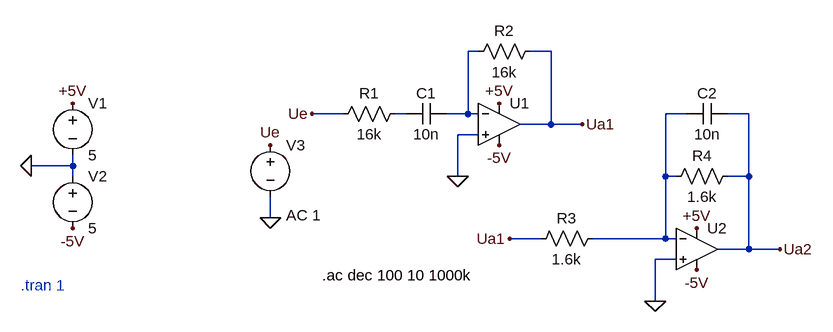
[diagram p0: schematic Draft1.asc]
Draft1.asc, the LTspice schematic file:
Version 4.1
SHEET 1 880 680
WIRE 256 16 240 16
WIRE 368 16 336 16
WIRE 48 112 0 112
WIRE 144 112 128 112
WIRE 240 112 240 16
WIRE 240 112 208 112
WIRE 256 112 240 112
WIRE 576 112 544 112
WIRE 672 112 640 112
WIRE 368 128 368 16
WIRE 368 128 320 128
WIRE 416 128 368 128
WIRE 256 144 224 144
WIRE -368 192 -368 176
WIRE -368 192 -432 192
WIRE -368 208 -368 192
WIRE 224 208 224 144
WIRE 544 208 544 112
WIRE 560 208 544 208
WIRE 672 208 672 112
WIRE 672 208 640 208
WIRE -64 272 -64 240
WIRE 352 304 304 304
WIRE 544 304 544 208
WIRE 544 304 432 304
WIRE 560 304 544 304
WIRE 672 320 672 208
WIRE 672 320 624 320
WIRE 720 320 672 320
WIRE 560 336 528 336
WIRE 528 400 528 336
FLAG 416 128 Ua1
FLAG -432 192 0
FLAG -368 96 +5V
FLAG -368 288 -5V
FLAG 288 96 +5V
FLAG 288 160 -5V
FLAG 224 208 0
FLAG 0 112 Ue
FLAG -64 160 Ue
FLAG -64 272 0
FLAG 592 288 +5V
FLAG 592 352 -5V
FLAG 528 400 0
FLAG 720 320 Ua2
FLAG 304 304 Ua1
SYMBOL voltage -368 80 R0
WINDOW 123 0 0 Left 0
WINDOW 39 0 0 Left 0
SYMATTR InstName V1
SYMATTR Value 5
SYMBOL cap 208 96 R90
WINDOW 0 0 32 VBottom 2
WINDOW 3 32 32 VTop 2
SYMATTR InstName C1
SYMATTR Value 10n
SYMBOL res 144 96 R90
WINDOW 0 0 56 VBottom 2
WINDOW 3 32 56 VTop 2
SYMATTR InstName R1
SYMATTR Value 16k
SYMBOL res 352 0 R90
WINDOW 0 0 56 VBottom 2
WINDOW 3 32 56 VTop 2
SYMATTR InstName R2
SYMATTR Value 16k
SYMBOL OpAmps\\UniversalOpAmp2 288 128 R0
SYMATTR InstName U1
SYMBOL voltage -368 192 R0
WINDOW 123 0 0 Left 0
WINDOW 39 0 0 Left 0
SYMATTR InstName V2
SYMATTR Value 5
SYMBOL voltage -64 144 R0
WINDOW 123 24 124 Left 2
WINDOW 39 0 0 Left 0
SYMATTR Value2 AC 1
SYMATTR InstName V3
SYMATTR Value ""
SYMBOL cap 640 96 R90
WINDOW 0 0 32 VBottom 2
WINDOW 3 32 32 VTop 2
SYMATTR InstName C2
SYMATTR Value 10n
SYMBOL res 448 288 R90
WINDOW 0 0 56 VBottom 2
WINDOW 3 32 56 VTop 2
SYMATTR InstName R3
SYMATTR Value 1.6k
SYMBOL res 656 192 R90
WINDOW 0 0 56 VBottom 2
WINDOW 3 32 56 VTop 2
SYMATTR InstName R4
SYMATTR Value 1.6k
SYMBOL OpAmps\\UniversalOpAmp2 592 320 R0
SYMATTR InstName U2
TEXT -448 376 Left 2 ;.tran 1
TEXT 16 360 Left 2 !.ac dec 100 10 1000k

The netlist it stands for:
* Draft1.asc
V1 +5V 0 5
C1 N001 N002 10n
R1 N002 Ue 16k
R2 Ua1 N001 16k
X§U1 0 N001 +5V -5V Ua1 level2 Avol=1Meg GBW=10Meg Slew=10Meg Ilimit=25m Rail=0 Vos=0 En=0 Enk=0 In=0 Ink=0 Rin=500Meg  ; pins In+ In- V+ V- OUT
V2 0 -5V 5
V3 Ue 0 AC 1
C2 Ua2 N003 10n
R3 N003 Ua1 1.6k
R4 Ua2 N003 1.6k
X§U2 0 N003 +5V -5V Ua2 level2 Avol=1Meg GBW=10Meg Slew=10Meg Ilimit=25m Rail=0 Vos=0 En=0 Enk=0 In=0 Ink=0 Rin=500Meg  ; pins In+ In- V+ V- OUT
* .tran 1
.ac dec 100 10 1000k
.lib UniversalOpAmp2.lib
.backanno
.end

* Results of the author's LTspice run, read from the files saved beside the schematic
* Operating Point, zero values left out:
*   V(+5v) = 5 V
*   V(-5v) = -5 V
*   I(V1) = -999.9 µA
*   I(V2) = -999.9 µA
*   Ix(u2:3) = 500 µA
*   Ix(u2:4) = -500 µA
*   Ix(u1:3) = 500 µA
*   Ix(u1:4) = -500 µA
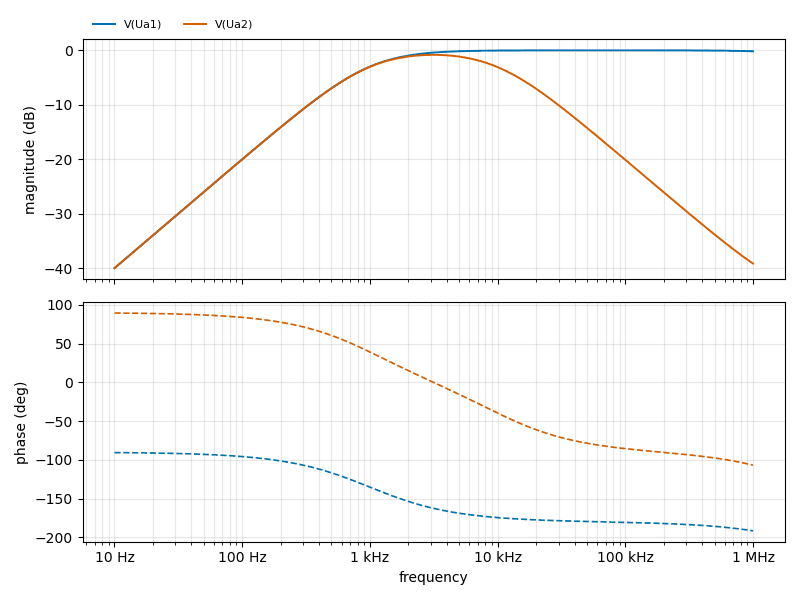
[diagram p1: AC Analysis of Draft1.asc, plotted from the saved traces]
* AC Analysis, 1 run:
*   V(Ua1): -39.95 dB at 10 Hz, -0.18 dB at 1 MHz, peak -0.00 dB at 69.18 kHz, 3 dB below the peak at 994.5 Hz
*   V(Ua2): -39.95 dB at 10 Hz, -39.11 dB at 1 MHz, peak -0.83 dB at 3.162 kHz, 3 dB below the peak at 839.8 Hz and 11.77 kHz